# Altium schematic sheet SDR_Tuner.SchDoc
size B; SheetNumber: 3; SheetTotal: 4
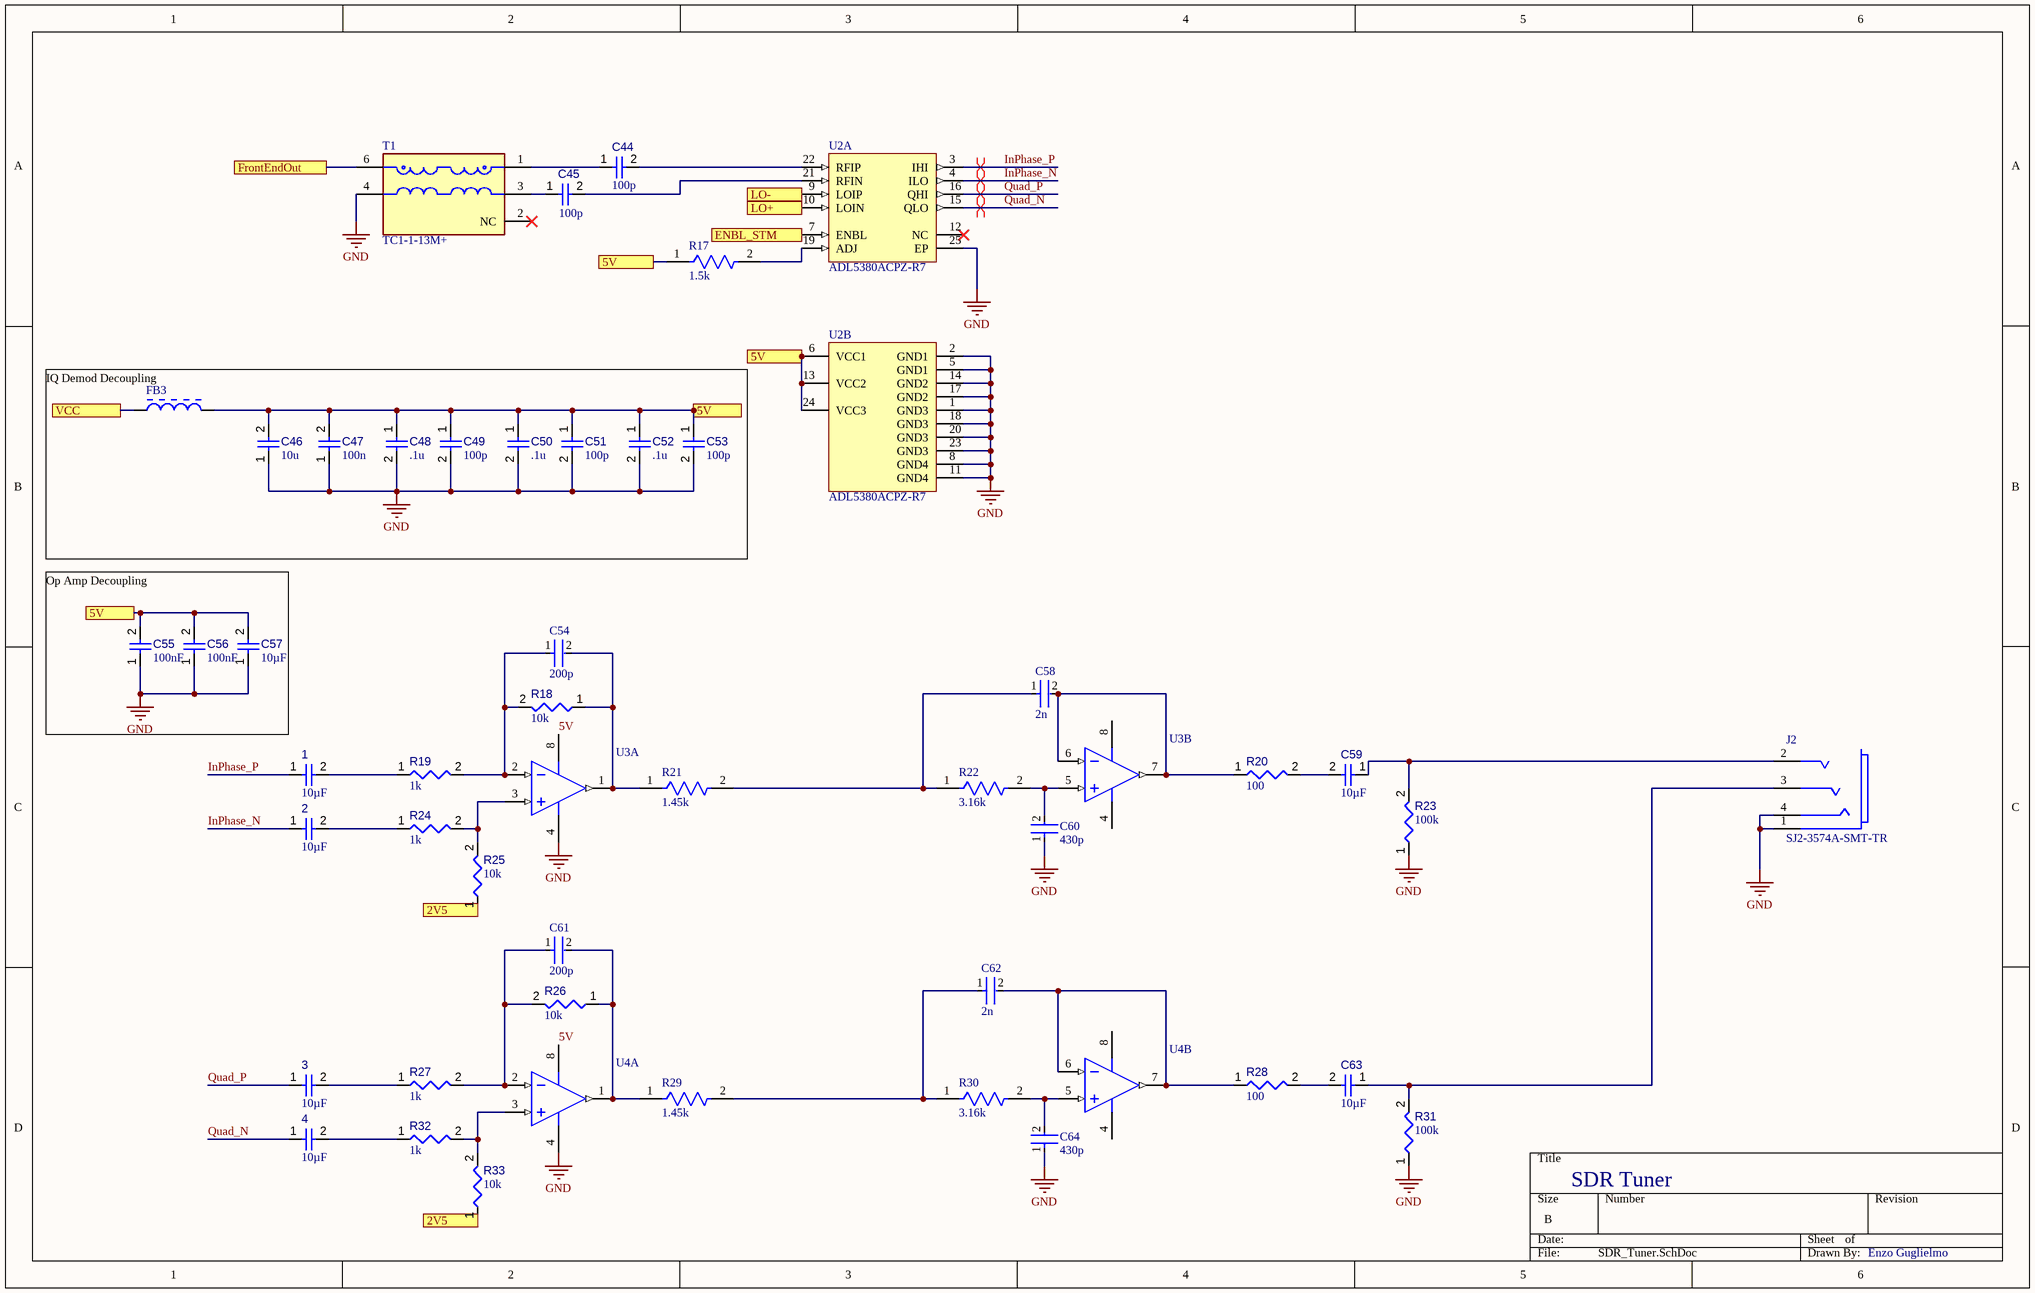
[diagram p0: SDR_Tuner.SchDoc]

## Parts
1  value 10µF  [CAPC0603(1608)100_L]  (hidden comment: Capacitor 10µF +/-20% 10V 0603)
2  value 10µF  [CAPC0603(1608)100_L]  (hidden comment: Capacitor 10µF +/-20% 10V 0603)
3  value 10µF  [CAPC0603(1608)100_L]  (hidden comment: Capacitor 10µF +/-20% 10V 0603)
4  value 10µF  [CAPC0603(1608)100_L]  (hidden comment: Capacitor 10µF +/-20% 10V 0603)
C44  value 100p  [CAPC0402(1005)60_L]  (hidden comment: Capacitor 100nF +/-20% 25V 0402)
C45  value 100p  [CAPC0402(1005)60_L]  (hidden comment: Capacitor 100nF +/-20% 25V 0402)
C46  value 10u  [CAPC0402(1005)60_L]  (hidden comment: Capacitor 100nF +/-20% 25V 0402)
C47  value 100n  [CAPC0402(1005)60_L]  (hidden comment: Capacitor 100nF +/-20% 25V 0402)
C48  value .1u  [CAPC0402(1005)60_L]  (hidden comment: Capacitor 100nF +/-20% 25V 0402)
C49  value 100p  [CAPC0402(1005)60_L]  (hidden comment: Capacitor 100nF +/-20% 25V 0402)
C50  value .1u  [CAPC0402(1005)60_L]  (hidden comment: Capacitor 100nF +/-20% 25V 0402)
C51  value 100p  [CAPC0402(1005)60_L]  (hidden comment: Capacitor 100nF +/-20% 25V 0402)
C52  value .1u  [CAPC0402(1005)60_L]  (hidden comment: Capacitor 100nF +/-20% 25V 0402)
C53  value 100p  [CAPC0402(1005)60_L]  (hidden comment: Capacitor 100nF +/-20% 25V 0402)
C54  200p  [FP-GCM155-0_05-IPC_A]
C55  value 100nF  [CAPC0402(1005)60_L]  (hidden comment: Capacitor 100nF +/-20% 10V 0402)
C56  value 100nF  [CAPC0402(1005)60_L]  (hidden comment: Capacitor 100nF +/-20% 10V 0402)
C57  value 10µF  [CAPC0402(1005)60_L]  (hidden comment: Capacitor 10µF +/-40% 6.3V 0402)
C58  2n  [FP-GRM188-0_1-e0_2_0_5-IPC_B]
C59  value 10µF  [CAPC0402(1005)60_L]  (hidden comment: Capacitor 10µF +/-40% 6.3V 0402)
C60  430p  [FP-GCM155-0_05-MFG]
C61  200p  [FP-GCM155-0_05-IPC_A]
C62  2n  [FP-GRM188-0_1-e0_2_0_5-IPC_B]
C63  value 10µF  [CAPC0402(1005)60_L]  (hidden comment: Capacitor 10µF +/-40% 6.3V 0402)
C64  430p  [FP-GCM155-0_05-MFG]
FB3  BLM21PG331SN1D  [INDC2013X105X50ML20T20]  (value not drawn)
J2  SJ2-3574A-SMT-TR  [FP-SJ2-3574A-SMT-TR-MFG]
R17  1.5k  [FP-RN73R1E-MFG]
R18  value 10k  [RESC0402(1005)_L]  (hidden comment: Resistor 10K  +/-1 % 0402 63 mW)
R19  value 1k  [RESC0402(1005)_L]  (hidden comment: Resistor 1K +/-5 % 0402 63 mW)
R20  value 100  [RESC0402(1005)_L]  (hidden comment: 100R2F)
R21  1.45k  [FP-RN73R1E-IPC_B]
R22  3.16k  [FP-RN73R1E-IPC_B]
R23  value 100k  [RESC0402(1005)_L]  (hidden comment: 100KR2F)
R24  value 1k  [RESC0402(1005)_L]  (hidden comment: Resistor 1K +/-5 % 0402 63 mW)
R25  value 10k  [RESC0402(1005)_L]  (hidden comment: Resistor 10K  +/-1 % 0402 63 mW)
R26  value 10k  [RESC0402(1005)_L]  (hidden comment: Resistor 10K  +/-1 % 0402 63 mW)
R27  value 1k  [RESC0402(1005)_L]  (hidden comment: Resistor 1K +/-5 % 0402 63 mW)
R28  value 100  [RESC0402(1005)_L]  (hidden comment: 100R2F)
R29  1.45k  [FP-RN73R1E-IPC_B]
R30  3.16k  [FP-RN73R1E-IPC_B]
R31  value 100k  [RESC0402(1005)_L]  (hidden comment: 100KR2F)
R32  value 1k  [RESC0402(1005)_L]  (hidden comment: Resistor 1K +/-5 % 0402 63 mW)
R33  value 10k  [RESC0402(1005)_L]  (hidden comment: Resistor 10K  +/-1 % 0402 63 mW)
T1  TC1-1-13M+  [FP-TC1-1-13M+-MFG]
U2  ADL5380ACPZ-R7  [ADI-CP-24-3_N]  (parts A,B of 2)
U3  LT6203CMS8#TRPBF  [LT-MS8-8_L]  (value not drawn)  (parts A,B of 2)
U4  LT6203CMS8#TRPBF  [LT-MS8-8_L]  (value not drawn)  (parts A,B of 2)

## Ports
2V5 (see SDR_Power[4D], SDR_Tuner[2C]), 2V5 (see SDR_Power[4D], SDR_Tuner[2D]), 5V (see SDR_Tuner[1B], SDR_Tuner[2A], SDR_Tuner[3B]), 5V (see SDR_Tuner[1B], SDR_Tuner[3B]), 5V (see SDR_Tuner[2A], SDR_Tuner[3B]), ENBL_STM (see SDR_LO[6C]), FrontEndOut (see SDR_FrontEnd[5B]), LO+ (see SDR_LO[6A]), LO- (see SDR_LO[6A]), VCC (see SDR_FrontEnd[1C], SDR_Power[1C], SDR_Power[1D], SDR_Power[3A], SDR_Power[3D], SDR_Power[4C])

## Nets
GND: C46.1 C47.1 C48.2 C49.2 C50.2 C51.2 C52.2 C53.2 C55.1 C56.1 C57.1 C60.1 C64.1 J2.1(sleeve) J2.4(ring_2) R23.1 R31.1 T1.4(PRIMARY) U2.1(GND3) U2.2(GND1) U2.5(GND1) U2.8(GND4) U2.11(GND4) U2.14(GND2) U2.17(GND2) U2.18(GND3) U2.20(GND3) U2.23(GND3) U2.25(EP) U3.4(V-) U4.4(V-)
2V5: R25.1 R33.1 ; port 2V5
5V: C46.2 C47.2 C48.1 C49.1 C50.1 C51.1 C52.1 C53.1 C55.2 C56.2 C57.2 FB3.2 R17.1 U2.6(VCC1) U2.13(VCC2) U2.24(VCC3) ; port 5V
5V: U3.8(V+) U4.8(V+)  [a separate net that carries the same name]
ENBL_STM: U2.7(ENBL) ; port ENBL_STM
FrontEndOut: T1.6(PRIMARY_DOT) ; port FrontEndOut
InPhase_N: 2.1 U2.4(ILO)
InPhase_P: 1.1 U2.3(IHI)
LO+: U2.10(LOIN) ; port LO+
LO-: U2.9(LOIP) ; port LO-
Quad_N: 4.1 U2.15(QLO)
Quad_P: 3.1 U2.16(QHI)
VCC: FB3.1 ; port VCC
Net1_2: 1.2 R19.1
Net2_2: 2.2 R24.1
Net3_2: 3.2 R27.1
Net4_2: 4.2 R32.1
NetC44_1: C44.1 T1.1(SECONDARY_DOT)
NetC44_2: C44.2 U2.22(RFIP)
NetC45_1: C45.1 T1.3(SECONDARY)
NetC45_2: C45.2 U2.21(RFIN)
NetC54_1: C54.1 R18.2 R19.2 U3.2(-IN_A)
NetC54_2: C54.2 R18.1 R21.1 U3.1(OUT_A)
NetC58_1: C58.1 R21.2 R22.1
NetC58_2: C58.2 R20.1 U3.6(-IN_B) U3.7(OUT_B)
NetC59_1: C59.1 J2.2(tip) R23.2
NetC59_2: C59.2 R20.2
NetC60_2: C60.2 R22.2 U3.5(+IN_B)
NetC61_1: C61.1 R26.2 R27.2 U4.2(-IN_A)
NetC61_2: C61.2 R26.1 R29.1 U4.1(OUT_A)
NetC62_1: C62.1 R29.2 R30.1
NetC62_2: C62.2 R28.1 U4.6(-IN_B) U4.7(OUT_B)
NetC63_1: C63.1 J2.3(ring_1) R31.2
NetC63_2: C63.2 R28.2
NetC64_2: C64.2 R30.2 U4.5(+IN_B)
NetR17_2: R17.2 U2.19(ADJ)
NetR24_2: R24.2 R25.2 U3.3(+IN_A)
NetR32_2: R32.2 R33.2 U4.3(+IN_A)

Not connected (* = marked no-connect by the designer): T1 2(NC)*; U2 12(NC)*

## Layout directives
differential pair: InPhase_N, InPhase_P, Quad_N, Quad_P

## Notes on the sheet
- IQ Demod Decoupling
- Op Amp Decoupling
- SDR Tuner
- Enzo Guglielmo

## Library data of the parts
1-4 = CMP-001-00075-4: Chip Capacitor, 10µF +/-20%, 10V, 0603, Thickness 1 mm; Tolerance: 10%; Voltage Rating: 10V; Max Operating Temperature: 85°C; Pins: 2; Case/Package: 0603; Mounting Technology: SMT; Min Operating Temperature: -55°C
C44-C53 = CMP-001-00065-4: Chip Capacitor, 100nF +/-20%, 25V, 0402, Thickness 0.6 mm; Tolerance: 10%; Max Operating Temperature: 85°C; Min Operating Temperature: -55°C; Pins: 2; Voltage Rating: 25V; Mounting Technology: SMT; Case/Package: 0402
C54 C61 = CMP-06035-011527-1: Ceramic Capacitor for Automotive 200pF ±1% 50VDC C0G 0402 Paper T/R
C55 C56 = CMP-001-00061-3: Chip Capacitor, 100nF +/-20%, 10V, 0402, Thickness 0.6 mm; Tolerance: 20%; Mounting Technology: SMT; Voltage Rating: 10V; Max Operating Temperature: 85°C; Pins: 2; Case/Package: 0402; Min Operating Temperature: -55°C
C57 C59 C63 = CMP-001-00074-3: Chip Capacitor, 10µF +/-40%, 6.3V, 0402, Thickness 0.6 mm; Tolerance: 10%; Case/Package: 0402; Pins: 2; Mounting Technology: SMT; Voltage Rating: 6.3V; Max Operating Temperature: 85°C; Min Operating Temperature: -55°C
C58 C62 = CMP-2006-02494-2: Chip Multilayer Ceramic Capacitors for General Purpose, 0603, 2000pF, C0G, 30ppm/°C, 5%, 50V; Capacitance: 2nF; Voltage Rating (DC): 50V; Depth: 0.8mm; Material: Ceramic; Package Quantity: 1; Packaging: Tape and Reel; Case Code (Imperial): 0603; Termination: SMD/SMT; Min Operating Temperature: -55°C; Dielectric: C0G; Tolerance: 5%; Case/Package: 0603; REACH SVHC: No SVHC; Max Operating Temperature: 125°C; Length: 1.6mm; Case Code (Metric): 1608; Voltage: 50V; Lead Free: Lead Free; Thickness: 0.035inch; Height: 0.8mm; Mount: Surface Mount; Radiation Hardening: No; Voltage Rating: 50V; Width: 0.8mm
C60 C64 = CMP-06035-017991-1: Ceramic Capacitor for Automotive 430pF ±1% 50VDC C0G 0402 Paper T/R
FB3 = CMP-006-00000-3: IND, Chip Ferrite Bead, 330 Ohm, +/- 25%, 1.5 A, -55 to 125 degC, 0805 (2012 Metric), Tape and Reel; Manufacturer: Murata; Current Rating: 1.5A; Impedance: 330Ohm; Resistance: 90mohm; Max Operating Temperature: 125°C; Core Material: Ferrite; Case/Package: 0805; Mounting Technology: SM; Datasheet URL: http://psearch.en.murata.com/inductor/product/LQG15HS15NJ02_.pdf; Packaging: TapeandReel; Min Operating Temperature: -55°C; RoHS Compliant: True; Max Current Rating: 1.5A; Datasheet Version: Nov-11; Package Quantity: 4000; Package Reference: 0805; Package Description: 2-Pin Surface Mount Device, Body 2 x1.25 mm; Tolerance: 25%
J2 = CMP-14818-000001-1: AUDIO JACK, 3.5 MM, RT, 4 CONDUC; Manufacturer: CUI; Conn Orientation: Horizontal; Current Rating: 1A; Number Of Contacts: 4; Voltage Rating: 12V; Package: SJ2-3574A-SMT-TR; Device Class L1: Connectors; Lead Free: Yes; Digikey Description: AUDIO JACK, 3.5 MM, RT, 4 CONDUC; Device Class L2: Audio / Video Connectors; ComponentLink2URL: https://www.cui.com/product/resource/sj2-357x-smt.pdf; Automotive: No; RoHS: TRUE; Height: 5.3mm; Temperature Range Low: -25°C; Category: Conn; Temperature: -25°C to +85°C; Octopart: https://octopart.com/sj2-3574a-smt-tr-cui-77838840; Device Class L3: unset; Contact Material: Silver; Manufacturer Part Number: SJ2-3574A-SMT-TR; Temperature Range High: +85°C; ComponentLink2Description: Datasheet
R17 = CMP-04015-032974-1: 1.5kΩ ±1% 0.063W, 1/16W Chip Resistor 0402 (1005 Metric) Moisture Resistant Thin Film
R18 R25 R26 R33 = CMP-009-00149-3: Chip Resistor, 10 kOhms, +/-1 %, 63 mW, -55 to 125 degC, 0402; Power: 63mW; Tolerance: 1%; Min Operating Temperature: -55°C; Case/Package: 0402; Max Operating Temperature: 155°C; Pins: 2
R19 R24 R27 R32 = CMP-009-00157-3: Chip Resistor, 1 kOhms, +/-5 %, 63 mW, -55 to 155 degC, 0402; Tolerance: 5%; Power: 63mW; Case/Package: 0402; Pins: 2; Min Operating Temperature: -55°C; Max Operating Temperature: 155°C
R20 R28 = CMP-009-00065-2: 100R 0.063W 1% 0402 (1005 Metric)  SMD; Power: 63mW; Tolerance: 1%; Case/Package: 0402; Pins: 2; Mounting Technology: SMT
R21 R29 = CMP-04015-052789-1: 1.45kΩ ±0.1% 0.063W, 1/16W Chip Resistor 0402 (1005 Metric) Moisture Resistant Thin Film
R22 R30 = CMP-04015-052789-1: Res Thick Film 0402 3.16K Ohm 1% 0.1W(1/10W) ±100ppm/C Pad SMD Automotive T/R
R23 R31 = CMP-009-00064-2: 100K 0.063W 1% 0402 (1005 Metric)  SMD; Power: 63mW; Case/Package: 0402; Mounting Technology: SMT; Pins: 2; Tolerance: 1%
T1 = CMP-199822-000006-1: RF Transformer Surface Mount 50Ω 4.5 to 3000 MHz; Manufacturer: Mini-Circuits; Insertion Loss: 0.18-3.02dB; Frequency: 4.5-3000MHz; Turns Ratio: 1:1; RoHS: TRUE; Temperature Range Low: -40°C; Manufacturer Part Number: TC1-1-13M+; Octopart: https://octopart.com/tc1-1-13m%2B-mini-circuits-3993639; Automotive: No; ComponentLink2URL: https://www.minicircuits.com/pdfs/TC1-1-13M+.pdf; Device Class L2: Transformers; Device Class L1: Passive Components; Lead Free: Yes; Device Class L3: unset; Category: Trans; Temperature Range High: +85°C; Package: 0; Footprint Url: https://www.minicircuits.com/case_style/AT224-1A.pdf; Temperature: -40°C to +85°C; Height: 4.06mm; ComponentLink2Description: Datasheet
U2 = CMP-0285-00050-1: 400 MHz to 6 GHz Quadrature Demodulator, CP-24-3, Pb-Free, 1500 Reel; Min RF Frequency (MHz): 400MHz; Output P1dB (dBm): 12; IQ Freq (MHz): 390MHz; Max RF Frequency (MHz): 6GHz; Amplitude Error (dB): 70mdB; IIP3 (+dBm): 22dBm; Phase Error (deg): 0.2Deg; ComponentLink1Description: Manufacturer URL; ComponentLink3URL: http://www.analog.com/static/imported-files/packages/56702234806764CP_24_3.pdf; DatasheetVersion: Rev. 0; PackageReference: CP-24-3; ComponentLink2Description: Datasheet; ComponentLink1URL: www.analog.com; ComponentLink2URL: http://www.analog.com/static/imported-files/data_sheets/ADL5380.pdf; PackageVersion: Jan-2005; PackageDescription: 24-Lead Lead Frame Chip Scale Package [LFCSP_VQ]; ComponentLink3Description: Package Specification; Code_JEDEC: MO-220-VGGD-8
U3 U4 = CMP-0359-00717-2: Dual Channel, Low Noise, High Speed Operational Amplifier, RRIO, 100 MHz Typical GBW, 25 V/us Typical SR, 2.5 to 12.6 V, 8-Pin SOP (MS8-8), Commercial, Pb-Free, Reel; Manufacturer: Linear Technology; Linear Technology Part Number: LT6203; Vos (mV) Guaranteed: 0.5; Vs Max (V): 12.6; GBW (MHz) Typical: 100; Vs Min (V): 2.5; Vos (mV) Typical: 0.1; SR (V/us) Typical: 25; Is (mA) Typical: 2.8; Channels (#): 2; PartNumber: LT6203CMS8#TRPBF; ComponentLink2Description: Datasheet; ComponentLink1Description: Manufacturer URL; ComponentLink3Description: Package Specification; PackageDescription: 8-Lead Plastic Small Outline, Body 3.9 x 4.9 mm, Pitch 1.27 mm; DatasheetVersion: Rev. D; RevisionNote: URLs updated; PackageReference: LT-MS8-8; Mounting Technology: Surface Mount; Packing: Reel; ComponentLink2URL: http://cds.linear.com/docs/en/datasheet/620234fd.pdf; ComponentLink1URL: http://www.linear.com/; RoHS: Pb-Free; PackageVersion: Rev G; ComponentLink3URL: http://cds.linear.com/docs/en/packaging/05081610_G_SO8.pdf; Type: VFB